# EAGLE schematic M480B Input module (EAGLE 7.2.0)
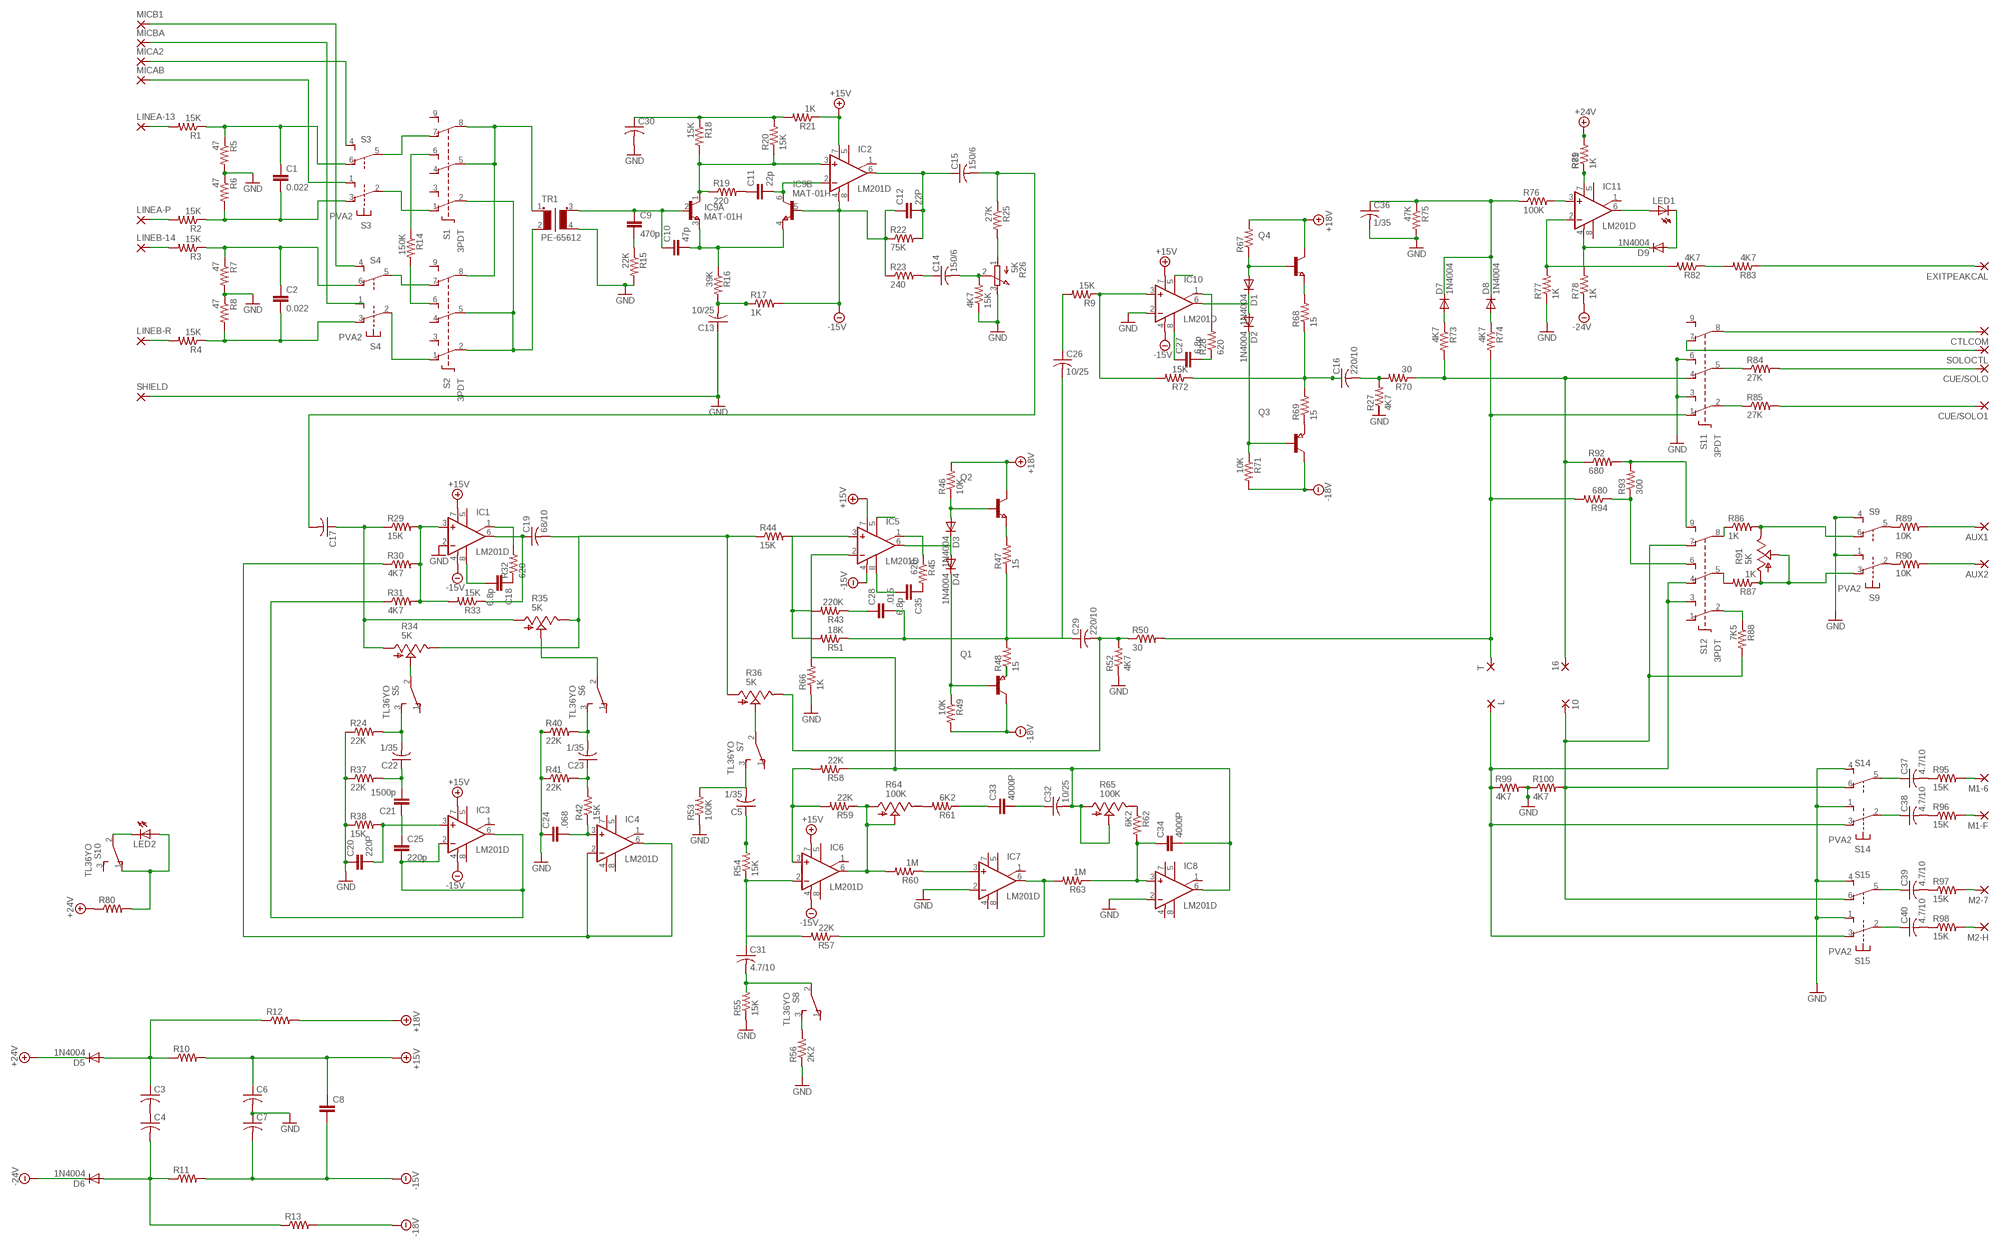
[diagram p0: schematic, sheet 1]

## Parts
4K7  15K  R-US_R0805  [R0805]
10  SMD2  [SMD1,27-2,54]
16  SMD2  [SMD1,27-2,54]
AUX1  SMD2  [SMD1,27-2,54]
AUX2  SMD2  [SMD1,27-2,54]
C1  0.022  C2.5/5  [C2.5-5]
C2  0.022  C2.5/5  [C2.5-5]
C3  C-USC0805  [C0805]
C4  C-USC0805  [C0805]
C5  1/35  C-USC0805  [C0805]
C6  C-USC0805  [C0805]
C7  C-USC0805  [C0805]
C8  C2.5/5  [C2.5-5]
C9  470p  C2.5/5  [C2.5-5]
C10  47p  C2.5/5  [C2.5-5]
C11  22p  C2.5/5  [C2.5-5]
C12  22P  C2.5/5  [C2.5-5]
C13  10/25  C-USC0805  [C0805]
C14  150/6  C-USC0805  [C0805]
C15  150/6  C-USC0805  [C0805]
C16  220/10  C-USC0805  [C0805]
C17  C-USC0805  [C0805]
C18  6.8p  C2.5/5  [C2.5-5]
C19  68/10  C-USC0805  [C0805]
C20  220P  C2.5/5  [C2.5-5]
C21  1500p  C2.5/5  [C2.5-5]
C22  1/35  C-USC0805  [C0805]
C23  1/35  C-USC0805  [C0805]
C24  .068  C2.5/5  [C2.5-5]
C25  220p  C2.5/5  [C2.5-5]
C26  10/25  C-USC0805  [C0805]
C27  6.8p  C2.5/5  [C2.5-5]
C28  .015  C2.5/5  [C2.5-5]
C29  220/10  C-USC0805  [C0805]
C30  C-USC0805  [C0805]
C31  4.7/10  C-USC0805  [C0805]
C32  10/25  C-USC0805  [C0805]
C33  4000P  C2.5/5  [C2.5-5]
C34  4000P  C2.5/5  [C2.5-5]
C35  6.8p  C2.5/5  [C2.5-5]
C36  1/35  C-USC0805  [C0805]
C37  4.7/10  C-USC0805  [C0805]
C38  4.7/10  C-USC0805  [C0805]
C39  4.7/10  C-USC0805  [C0805]
C40  4.7/10  C-USC0805  [C0805]
CTLCOM  SMD2  [SMD1,27-2,54]
CUE/SOLO  SMD2  [SMD1,27-2,54]
CUE/SOLO1  SMD2  [SMD1,27-2,54]
D1  1N4004  [DO41-10]
D2  1N4004  [DO41-10]
D3  1N4004  [DO41-10]
D4  1N4004  [DO41-10]
D5  1N4004  [DO41-10]
D6  1N4004  [DO41-10]
D7  1N4004  [DO41-10]
D8  1N4004  [DO41-10]
D9  1N4004  [DO41-10]
EXITPEAKCAL  SMD2  [SMD1,27-2,54]
IC1  LM201D  [SO08]
IC2  LM201D  [SO08]
IC3  LM201D  [SO08]
IC4  LM201D  [SO08]
IC5  LM201D  [SO08]
IC6  LM201D  [SO08]
IC7  LM201D  [SO08]
IC8  LM201D  [SO08]
IC9  MAT-01H  [TO78]
IC10  LM201D  [SO08]
IC11  LM201D  [SO08]
L  SMD2  [SMD1,27-2,54]
LED1  LED  [SMARTLED-TTW]
LED2  LED  [SMARTLED-TTW]
LINEA-13  SMD2  [SMD1,27-2,54]
LINEA-P  SMD2  [SMD1,27-2,54]
LINEB-14  SMD2  [SMD1,27-2,54]
LINEB-R  SMD2  [SMD1,27-2,54]
M1-6  SMD2  [SMD1,27-2,54]
M1-F  SMD2  [SMD1,27-2,54]
M2-7  SMD2  [SMD1,27-2,54]
M2-H  SMD2  [SMD1,27-2,54]
MICA2  SMD2  [SMD1,27-2,54]
MICAB  SMD2  [SMD1,27-2,54]
MICB1  SMD2  [SMD1,27-2,54]
MICBA  SMD2  [SMD1,27-2,54]
Q1  PNP-TRANSISTOR_SOT23  [SOT23]
Q2  NPN-TRANSISTOR_SOT23  [SOT23]
Q3  PNP-TRANSISTOR_SOT23  [SOT23]
Q4  NPN-TRANSISTOR_SOT23  [SOT23]
R1  15K  R-US_R0805  [R0805]
R2  15K  R-US_R0805  [R0805]
R3  15K  R-US_R0805  [R0805]
R4  15K  R-US_R0805  [R0805]
R5  47  R-US_R0805  [R0805]
R6  47  R-US_R0805  [R0805]
R7  47  R-US_R0805  [R0805]
R8  47  R-US_R0805  [R0805]
R9  15K  R-US_R0805  [R0805]
R10  R-US_R0805  [R0805]
R11  R-US_R0805  [R0805]
R12  R-US_R0805  [R0805]
R13  R-US_R0805  [R0805]
R14  150K  R-US_R0805  [R0805]
R15  22K  R-US_01005  [R01005]
R16  39K  R-US_R0805  [R0805]
R17  1K  R-US_R0805  [R0805]
R18  15K  R-US_R0805  [R0805]
R19  220  R-US_01005  [R01005]
R20  15K  R-US_R0805  [R0805]
R21  1K  R-US_R0805  [R0805]
R22  75K  R-US_R0805  [R0805]
R23  240  R-US_R0805  [R0805]
R24  22K  R-US_R0805  [R0805]
R25  27K  R-US_R0805  [R0805]
R26  5K  3RP/1610N  [3RP/1610N]
R27  4K7  R-US_R0805  [R0805]
R28  620  R-US_R0805  [R0805]
R29  15K  R-US_R0805  [R0805]
R30  4K7  R-US_R0805  [R0805]
R31  4K7  R-US_R0805  [R0805]
R32  620  R-US_R0805  [R0805]
R33  15K  R-US_R0805  [R0805]
R34  5K  TRIM_US-3223G  [3223G]
R35  5K  TRIM_US-3223G  [3223G]
R36  5K  TRIM_US-3223G  [3223G]
R37  22K  R-US_R0805  [R0805]
R38  15K  R-US_R0805  [R0805]
R40  22K  R-US_R0805  [R0805]
R41  22K  R-US_R0805  [R0805]
R42  15K  R-US_R0805  [R0805]
R43  220K  R-US_R0805  [R0805]
R44  15K  R-US_R0805  [R0805]
R45  620  R-US_R0805  [R0805]
R46  10K  R-US_R0805  [R0805]
R47  15  R-US_R0805  [R0805]
R48  15  R-US_R0805  [R0805]
R49  10K  R-US_R0805  [R0805]
R50  30  R-US_R0805  [R0805]
R51  18K  R-US_R0805  [R0805]
R52  4K7  R-US_R0805  [R0805]
R53  100K  R-US_R0805  [R0805]
R54  15K  R-US_R0805  [R0805]
R55  15K  R-US_R0805  [R0805]
R56  2K2  R-US_R0805  [R0805]
R57  22K  R-US_R0805  [R0805]
R58  22K  R-US_R0805  [R0805]
R59  22K  R-US_R0805  [R0805]
R60  1M  R-US_R0805  [R0805]
R61  6K2  R-US_R0805  [R0805]
R62  6K2  R-US_R0805  [R0805]
R63  1M  R-US_R0805  [R0805]
R64  100K  TRIM_US-3223G  [3223G]
R65  100K  TRIM_US-3223G  [3223G]
R66  1K  R-US_R0805  [R0805]
R67  R-US_R0805  [R0805]
R68  15  R-US_R0805  [R0805]
R69  15  R-US_R0805  [R0805]
R70  30  R-US_R0805  [R0805]
R71  10K  R-US_R0805  [R0805]
R72  15K  R-US_R0805  [R0805]
R73  4K7  R-US_R0805  [R0805]
R74  4K7  R-US_R0805  [R0805]
R75  47K  R-US_R0805  [R0805]
R76  100K  R-US_R0805  [R0805]
R77  1K  R-US_R0805  [R0805]
R78  1K  R-US_R0805  [R0805]
R79  R-US_R0805  [R0805]
R80  R-US_R0805  [R0805]
R81  1K  R-US_R0805  [R0805]
R82  4K7  R-US_R0805  [R0805]
R83  4K7  R-US_R0805  [R0805]
R84  27K  R-US_R0805  [R0805]
R85  27K  R-US_R0805  [R0805]
R86  1K  R-US_R0805  [R0805]
R87  1K  R-US_R0805  [R0805]
R88  7K5  R-US_R0805  [R0805]
R89  10K  R-US_R0805  [R0805]
R90  10K  R-US_R0805  [R0805]
R91  5K  TRIM_US-3223G  [3223G]
R92  680  R-US_R0805  [R0805]
R93  300  R-US_R0805  [R0805]
R94  680  R-US_R0805  [R0805]
R95  15K  R-US_R0805  [R0805]
R96  15K  R-US_R0805  [R0805]
R97  15K  R-US_R0805  [R0805]
R98  15K  R-US_R0805  [R0805]
R99  4K7  R-US_R0805  [R0805]
R100  4K7  R-US_R0805  [R0805]
S1  3PDT  [3PDT]
S2  3PDT  [3PDT]
S3  PVA2  [PVA2F]
S4  PVA2  [PVA2F]
S5  TL36YO  [TL3XYO]
S6  TL36YO  [TL3XYO]
S7  TL36YO  [TL3XYO]
S8  TL36YO  [TL3XYO]
S9  PVA2  [PVA2F]
S10  TL36YO  [TL3XYO]
S11  3PDT  [3PDT]
S12  3PDT  [3PDT]
S14  PVA2  [PVA2F]
S15  PVA2  [PVA2F]
SHIELD  SMD2  [SMD1,27-2,54]
SOLOCTL  SMD2  [SMD1,27-2,54]
T  SMD2  [SMD1,27-2,54]
TR1  PE-65612  [PE-65612]

## Nets
+15V: IC1.7(V+) IC2.7(V+) IC3.7(V+) IC5.7(V+) IC6.7(V+) IC10.7(V+) R21.1
+18V: C6.1 D5.C Q2.3(C) Q4.3(C) R10.2 R12.2 R46.2 R67.2 ; supply symbol labelled +15V, +24V
+24V: R79.2 R80.1 R81.2
-15V: IC1.4(V-) IC2.4(V-) IC3.4(V-) IC5.4(V-) IC6.4(V-) IC9.5(B:B) IC10.4(V-) R17.2 R22.1 R23.1
-18V: C7.2 D6.C Q1.3(C) Q3.3(C) R11.2 R13.2 R49.2 R71.2 ; supply symbol labelled -15V, -24V
-24V: R78.1
GND: 4K7.1 C6.2 C7.1 C13.1 C20.1 C24.1 C30.2 C36.2 IC1.2(-IN) IC7.2(-IN) IC8.2(-IN) IC10.2(-IN) R5.2 R6.1 R7.2 R8.1 R15.2 R24.1 R26.3(E) R37.1 R38.1 R40.1 R41.1 R52.1 R53.1 R55.1 R56.1 R66.1 R75.2 R77.1 R99.2 R100.1 S9.1(1:S) S9.4(2:S) S11.3(S1) S11.6(S2) S14.1(1:S) S14.4(2:S) S15.1(1:S) S15.4(2:S) SHIELD.1(P) TR1.4(S2)
N$1: C3.2 C4.1
N$2: C4.2 D6.A R11.1 R13.1
N$3: R2.1 R6.2 S3.3(1:O)
N$4: R1.1 R5.1 S3.6(2:O)
N$5: R3.1 R7.1 S4.6(2:O)
N$6: R4.1 R8.2 S4.3(1:O)
N$7: C3.1 D5.A R10.1 R12.1
N$8: S1.2(P1) S2.2(P1) S2.5(P2) TR1.2
N$9: LINEA-13.1(P) R1.2
N$10: LINEA-P.1(P) R2.2
N$11: LINEB-14.1(P) R3.2
N$12: LINEB-R.1(P) R4.2
N$13: S1.7(O3) S3.5(2:P)
N$14: S1.1(O1) S3.2(1:P)
N$15: S2.7(O3) S4.5(2:P)
N$16: S2.1(O1) S4.2(1:P)
N$17: R14.1 S1.6(S2)
N$18: R14.2 S2.6(S2)
N$19: S1.5(P2) S1.8(P3) S2.8(P3) TR1.1
N$20: C27.2 R28.1
N$21: C9.2 R15.1
N$22: C9.1 C10.1 IC9.2(A:B) TR1.3(S1)
N$23: C10.2 IC9.3(A:E) IC9.4(B:E) R16.1
N$24: C13.2 R16.2 R17.1
N$25: IC2.3(+IN) IC9.1(A:C) R18.2 R19.1 R20.1
N$26: C11.1 R19.2
N$27: C11.2 IC2.2(-IN) IC9.6(B:C)
N$28: C14.1 R23.2
N$29: C30.1 R18.1 R20.2 R21.2
N$30: IC10.1(ON/CMP) R28.2
N$31: C27.1 IC10.8(CMP)
N$32: C15.1 IC2.6(OUT) R22.2
N$33: 4K7.2 C14.2 R26.2(S)
N$34: C15.2 C17.2 R25.1
N$35: R25.2 R26.1(A)
N$36: C18.2 IC1.8(CMP)
N$37: IC1.1(ON/CMP) R32.2
N$38: C18.1 R32.1
N$39: IC1.3(+IN) R29.2 R30.2 R31.2 R33.2
N$40: C17.1 R29.1 R34.1(A) R35.1(A)
N$41: C19.1 IC1.6(OUT) R33.1
N$42: C19.2 R34.3(E) R35.3(E) R36.1(A) R44.1
N$43: C22.2 R24.2 S5.3(S)
N$44: C25.2 IC3.2(-IN) IC3.6(OUT) R31.1
N$45: C21.2 C22.1 R37.2
N$46: C23.2 R40.2 S6.3(S)
N$47: R34.2(S) S5.2(P)
N$48: R35.2(S) S6.2(P)
N$49: C23.1 R41.2 R42.2
N$50: C24.2 IC4.3(+IN) R42.1
N$51: C21.1 C25.1
N$52: CTLCOM.1(P) S11.8(P3)
N$53: IC4.2(-IN) IC4.6(OUT) R30.1
N$54: R36.2(S) S7.2(P)
N$55: C26.1 R9.2
N$56: R61.2 R64.3(E)
N$57: IC5.5(ON)
N$58: C35.2 IC5.8(CMP)
N$59: C35.1 R45.2
N$60: IC5.1(ON/CMP) R45.1
N$61: D3.C D4.A IC5.6(OUT)
N$62: C28.1 R43.1
N$63: D4.C Q1.1(B) R49.1
N$64: Q1.2(E) R48.1
N$65: Q2.2(E) R47.2
N$66: C29.2 R36.3(E) R50.1 R52.2
N$67: D3.A Q2.1(B) R46.1
N$68: C5.2 R53.2 S7.3(S)
N$69: C26.2 C28.2 C29.1 R47.1 R48.2 R51.1
N$70: C5.1 R54.2
N$71: C31.1 IC6.2(-IN) R54.1 R57.2
N$72: C31.2 R55.2 S8.2(P)
N$73: R56.2 S8.3(S)
N$74: IC6.3(+IN) R58.2 R59.2
N$75: IC7.3(+IN) R60.1
N$76: IC10.5(ON)
N$77: IC7.6(OUT) R57.1 R63.2
N$78: IC6.6(OUT) R59.1 R60.2 R64.1(A) R64.2(S)
N$79: C33.1 R61.1
N$80: C32.1 C33.2
N$81: C32.2 C34.2 IC5.2(-IN) IC8.6(OUT) R58.1 R65.1(A) R65.2(S) R66.2
N$82: R62.1 R65.3(E)
N$83: IC5.3(+IN) R43.2 R44.2 R51.2
N$84: C34.1 IC8.3(+IN) R62.2 R63.1
N$85: D1.C D2.A IC10.6(OUT)
N$86: IC10.3(+IN) R9.1 R72.2
N$87: D7.A R73.1
N$88: Q3.2(E) R69.1
N$89: Q4.2(E) R68.2
N$90: D1.A Q4.1(B) R67.1
N$91: C16.1 R68.1 R69.2 R72.1
N$92: C16.2 R27.2 R70.2
N$93: D2.C Q3.1(B) R71.1
N$94: D8.A R74.1
N$95: R50.2 R74.2 R94.2 S11.1(O1) T.1(P)
N$96: IC11.7(V+) R79.1 R81.1
N$97: R82.1 R83.2
N$98: IC11.3(+IN) R76.2
N$99: D9.C IC11.2(-IN) IC11.4(V-) R77.2 R78.2 R82.2
N$100: C36.1 D7.C D8.C R75.1 R76.1
N$101: LED2.C@1(C) S10.2(P)
N$102: LED2.A@1(A) R80.2 S10.1(O)
N$103: D9.A LED1.C@1(C)
N$104: IC11.6(OUT) LED1.A@1(A)
N$105: EXITPEAKCAL.1(P) R83.1
N$106: MICA2.1(P) S3.4(2:S)
N$107: MICAB.1(P) S3.1(1:S)
N$108: MICB1.1(P) S4.4(2:S)
N$109: MICBA.1(P)
N$110: C37.1 S14.5(2:P)
N$111: S11.7(O3) SOLOCTL.1(P)
N$112: R84.1 S11.5(P2)
N$113: R85.1 S11.2(P1)
N$114: CUE/SOLO.1(P) R84.2
N$115: CUE/SOLO1.1(P) R85.2
N$116: R86.1 S12.8(P3)
N$117: R87.2 S12.5(P2)
N$118: AUX1.1(P) R89.2
N$119: AUX2.1(P) R90.2
N$120: R86.2 R91.3(E) S9.6(2:O)
N$121: R87.1 R91.1(A) R91.2(S) S9.3(1:O)
N$122: R89.1 S9.5(2:P)
N$123: R90.1 S9.2(1:P)
N$124: 16.1(P) R70.1 R73.2 R92.1 S11.4(O2)
N$125: C38.1 S14.2(1:P)
N$126: C39.1 S15.5(2:P)
N$127: C40.1 S15.2(1:P)
N$128: R88.1 S12.2(P1)
N$129: R92.2 R93.2 S12.9(S3)
N$130: R93.1 R94.1 S12.6(S2)
N$131: C37.2 R95.1
N$132: C38.2 R96.1
N$133: L.1(P) R99.1 S12.3(S1) S12.4(O2) S14.3(1:O) S15.3(1:O)
N$134: 10.1(P) R88.2 R100.2 S12.7(O3) S14.6(2:O) S15.6(2:O)
N$135: C39.2 R97.1
N$136: C40.2 R98.1
N$137: M1-6.1(P) R95.2
N$138: M1-F.1(P) R96.2
N$139: M2-7.1(P) R97.2
N$140: M2-H.1(P) R98.2
N$141: C20.2 IC3.3(+IN) R38.2
Unconnected: C1.1 C1.2 C2.1 C2.2 C8.1 C8.2 C12.1 C12.2 IC1.5(ON) IC2.1(ON/CMP) IC2.5(ON) IC2.8(CMP) IC3.1(ON/CMP) IC3.5(ON) IC3.8(CMP) IC4.1(ON/CMP) IC4.5(ON) IC4.8(CMP) IC6.1(ON/CMP) IC6.5(ON) IC6.8(CMP) IC7.1(ON/CMP) IC7.5(ON) IC7.8(CMP) IC8.1(ON/CMP) IC8.5(ON) IC8.8(CMP) IC11.1(ON/CMP) IC11.5(ON) IC11.8(CMP) R27.1 S1.3(S1) S1.4(O2) S1.9(S3) S2.3(S1) S2.4(O2) S2.9(S3) S4.1(1:S) S5.1(O) S6.1(O) S7.1(O) S8.1(O) S10.3(S) S11.9(S3) S12.1(O1)

## Power pins joined to a net without a drawn wire
V+: IC4.7(V+) IC7.7(V+) IC8.7(V+)
V-: IC4.4(V-) IC7.4(V-) IC8.4(V-)

## Library data of the parts
4K7 R1-R14 R16-R18 R20-R25 R27-R33 R37 R38 R40-R63 R66-R90 R92-R100 = adafruit:R-US_: RESISTOR, American symbol
10 16 AUX1 AUX2 CTLCOM CUE/SOLO CUE/SOLO1 EXITPEAKCAL L LINEA-13 LINEA-P LINEB-14 LINEB-R M1-6 M1-F M2-7 M2-H MICA2 MICAB MICB1 MICBA SHIELD SOLOCTL T = wirepad:SMD2: SMD PAD
C1 C2 C8-C12 C18 C20 C21 C24 C25 C27 C28 C33-C35 = capacitor-wima:C: CAPACITOR naming: grid - package width
C3-C7 C13-C17 C19 C22 C23 C26 C29-C32 C36-C40 = adafruit:C-US: CAPACITOR, American symbol
D1-D9 = adafruit:1N4004: DIODE General purpose 1N400x type rectifier (With bigger pads) http://www.ladyada.net/library/pcb/eaglelibrary.html
IC1-IC8 IC10 IC11 = linear:LM201: OP AMP
IC9 = linear:MAT-01H: Dual TRANSISTOR
LED1 LED2 = adafruit:LED: LED OSRAM: - CHIPLED LG R971, LG N971, LY N971, LG Q971, LY Q971, LO R971, LY R971 LH N974, LH R974 LS Q976, LO Q976, LY Q976 LO Q996 - Hyper CHIPLED LW Q18S LB Q993, LB Q99A, LB R99A - SideLED LS A670, LO A670, LY A670, LG A670, LP A670 LB A673, LV A673, LT A673, LW A673 LH A674 LY A675 LS A676, LA A676, LO A676, LY A676, LW A676 LS A679, LY A679, LG A679 - Hyper Micro SIDELED® LS Y876, LA Y876, LO Y876, LY Y876 LT Y87S - SmartLED LW L88C, LW L88S LB L89C, LB L89S, LG L890 LS L89K, LO L89K, LY L89K LS L896, LA L896, LO L896, LY L896 - TOPLED LS T670, LO T670, LY T670, LG T670, LP T670 LSG T670, LSP T670, LSY T670, LOP T670, LYG T670 LG T671, LOG T671, LSG T671 LB T673, LV T673, LT T673, LW T673 LH T674 LS T676, LA T676, LO T676, LY T676, LB T676, LH T676, LSB T676, LW T676 LB T67C, LV T67C, LT T67C, LS T67K, LO T67K, LY T67K, LW E67C LS E67B, LA E67B, LO E67B, LY E67B, LB E67C, LV E67C, LT E67C LW T67C LS T679, LY T679, LG T679 LS T770, LO T770, LY T770, LG T770, LP T770 LB T773, LV T773, LT T773, LW T773 LH T774 LS E675, LA E675, LY E675, LS T675 LS T776, LA T776, LO T776, LY T776, LB T776 LHGB T686 LT T68C, LB T68C - Hyper Mini TOPLED® LB M676 - Mini TOPLED Santana® LG M470 LS M47K, LO M47K, LY M47K Source: http://www.osram.convergy.de/
Q1 Q3 = semicon-smd-ipc:PNP-TRANSISTOR_: PNP TRANSISTOR
Q2 Q4 = semicon-smd-ipc:NPN-TRANSISTOR_: NPN TRANSISTOR
R15 R19 = resistor:R-US_: RESISTOR, American symbol
R26 = pot:3RP/1610N: 16mm Potentiometer one level Source: http://www.alphapotentiometers.net/html/16mm_pot_2.html
R34-R36 R64 R65 R91 = pot:TRIM_US-: POTENTIOMETER
S1 S2 S11 S12 = switch:3PDT: 3PDT 9 pin footswitch SF17020F-0302-21R-L Source: 3PDT.jpg
S3 S4 S9 S14 S15 = switch-misc:PVA2: ITT SWITCH
S5-S8 S10 = switch:TL36YO: TINY SWITCH ON - ON Source: http://www2.produktinfo.conrad.com/datenblaetter/700000-724999/705152-da-01-de-Subminiaturschalter_TL_36YO.pdf
TR1 = transformer-pulse:PE-65612: TRANSFORMERS FOR DIGITAL AUDIO DATA TRANSMISSION Source: Data sheet <http://ww2.pulseeng.com/products/datasheets/T601.pdf> www.pulseeng.com